# Altium schematic sheet connect.SchDoc
size B; SheetNumber: 3; SheetTotal: 3
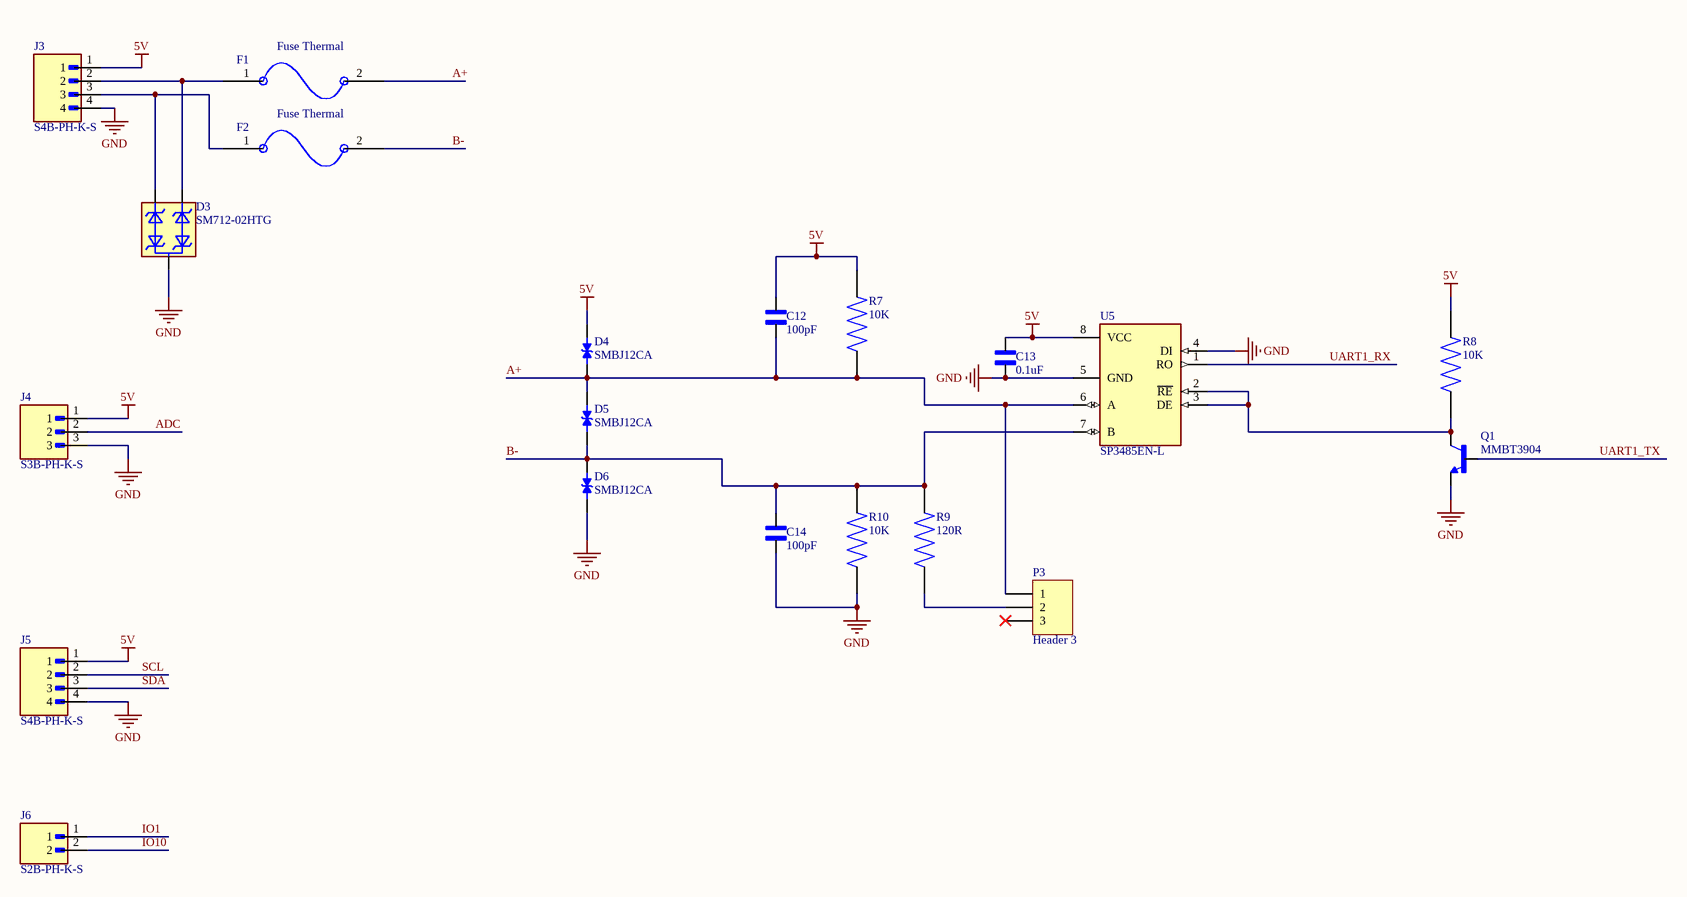
[diagram p0: connect.SchDoc]

## Parts
C12  100pF  [CAPC1005X61N]
C13  0.1uF  [CAPC1005X61N]
C14  100pF  [CAPC1005X61N]
D3  SM712-02HTG  [SOT23]
D4  SMBJ12CA  [DIOM4336X265N]
D5  SMBJ12CA  [DIOM4336X265N]
D6  SMBJ12CA  [DIOM4336X265N]
F1  Fuse Thermal  [RES_ERJU08J224V]
F2  Fuse Thermal  [RES_ERJU08J224V]
J3  S4B-PH-K-S  [JST_S4B-PH-K-S]
J4  S3B-PH-K-S  [JST_S3B-PH-K-S]
J5  S4B-PH-K-S  [JST_S4B-PH-K-S]
J6  S2B-PH-K-S  [JST_S2B-PH-K-S]
P3  Header 3  [HDR1X3]
Q1  MMBT3904  [TRANS_MMBT3904]
R7  10K  [RES_ERJU02F5102X]
R8  10K  [RES_ERJU02F5102X]
R9  120R  [RES_ERJU02F5102X]
R10  10K  [RES_ERJU02F5102X]
U5  SP3485EN-L  [SOIC127P599X175-8N]

## Nets
5V: C12.2 C13.2 D4.2 J3.1 J4.1 J5.1 R7.1 R8.1 U5.8(VCC)
GND: C13.1 C14.1 D3.3 D6.1 J3.4 J4.3 J5.4 Q1.2(E) R10.2 U5.4(DI) U5.5(GND)
A+: C12.1 D4.1 D5.2 F1.2 P3.1 R7.2 U5.6(A)
ADC: J4.2
B-: C14.2 D5.1 D6.2 F2.2 R9.1 R10.1 U5.7(B)
IO1: J6.1
IO10: J6.2
SCL: J5.2
SDA: J5.3
UART1_RX: U5.1(RO)
UART1_TX: Q1.1(B)
NetD3_1: D3.1 F1.1 J3.2
NetD3_2: D3.2 F2.1 J3.3
NetP3_2: P3.2 R9.2
NetQ1_3: Q1.3(C) R8.2 U5.2(~{RE}) U5.3(DE)

Not connected (* = marked no-connect by the designer): P3 3*

## Library data of the parts
C12-C14 = cap_0402_VJ0402D100MXCAP: cap 0402; MF: Vishay Vitramon; SnapEDA_Link: https://www.snapeda.com/parts/VJ0402D100MXCAP/Vishay/view-part/?ref=snap; Package: 1005 Vishay Vitramon; Value: *; MP: VJ0402D100MXCAP; Check_prices: https://www.snapeda.com/parts/VJ0402D100MXCAP/Vishay/view-part/?ref=eda
D3 = SM712-02HTG: TVS Diode, SM712 Series, 31V Clamp, 600W Peak Pulse, Surface Mount, SOT23-3 | Littelfuse SM712-02HTG; MF: Littelfuse Inc.; SnapEDA_Link: https://www.snapeda.com/parts/SM712-02HTG/Littelfuse/view-part/?ref=snap; Package: SOT-23 Littelfuse Inc.; Value: *; MP: SM712-02HTG; Check_prices: https://www.snapeda.com/parts/SM712-02HTG/Littelfuse/view-part/?ref=eda
D4-D6 = SMBJ10CA-13-F: MF: {'manufacturer': u'Diodes Incorporated'}; Package: None; Price: None; Value: *; MP: SMBJ10CA-13-F; Availability: Unavailable
F1 F2 = Fuse Thermal: Fuse, Resettable, Fast Acting, 10A, Sz 1206, 0.134x0.071x0.033", SMT, 24VDC, PCB | Bourns MF-NSMF200-2
J3 J5 = S4B-PH-K-S: Connector Header Through Hole, Right Angle 4 position 0.079 (2.00mm); MF: JST Sales; SnapEDA_Link: https://www.snapeda.com/parts/S4B-PH-K-S/JST/view-part/?ref=snap; Package: NON STANDARD-4 J.S.T.; Value: *; MP: S4B-PH-K-S; Check_prices: https://www.snapeda.com/parts/S4B-PH-K-S/JST/view-part/?ref=eda
J4 = S3B-PH-K-S: Connector Header Through Hole, Right Angle 3 position 0.079 (2.00mm); MF: JST Sales; SnapEDA_Link: https://www.snapeda.com/parts/S3B-PH-K-S/JST/view-part/?ref=snap; Package: NON STANDARD-3 J.S.T.; Value: *; MP: S3B-PH-K-S; Check_prices: https://www.snapeda.com/parts/S3B-PH-K-S/JST/view-part/?ref=eda
J6 = S2B-PH-K-S: Connector Header Through Hole, Right Angle 2 position 0.079 (2.00mm); MF: JST Sales; SnapEDA_Link: https://www.snapeda.com/parts/S2B-PH-K-S/JST/view-part/?ref=snap; Package: NON STANDARD-2 J.S.T.; Value: *; MP: S2B-PH-K-S; Check_prices: https://www.snapeda.com/parts/S2B-PH-K-S/JST/view-part/?ref=eda
P3 = Header 3: Header, 3-Pin; LatestRevisionDate: 17-Jul-2002; LatestRevisionNote: Re-released for DXP Platform.; Publisher: Altium Limited
Q1 = MMBT3904: BJT, SOT-23, 40V, 200mA, NPN, 0.35W, 150Â°C; MF: Diotec Semiconductor; SnapEDA_Link: https://www.snapeda.com/parts/MMBT3904/Diotec/view-part/?ref=snap; Package: SOT-23 Diotec; Value: *; MP: MMBT3904; Check_prices: https://www.snapeda.com/parts/MMBT3904/Diotec/view-part/?ref=eda
R7-R10 = res_0402_ERJU02F5102X: Availability: Unavailable; MP: ERJU02F5102X; Price: None; Package: None; Value: *
U5 = SP3485EN-L: 1/1 Transceiver Half RS422, RS485 8-SOIC; MF: MaxLinear, Inc.; SnapEDA_Link: https://www.snapeda.com/parts/SP3485EN-L/MaxLinear/view-part/?ref=snap; Package: None; Value: *; MP: SP3485EN-L; Check_prices: https://www.snapeda.com/parts/SP3485EN-L/MaxLinear/view-part/?ref=eda